# Altium schematic sheet Connector_Venus.SchDoc: Sample Sheet Title
size B; Date: MM/DD/YYYY; Author: Sample Author; Organization: ORGANIZATION; Address1: ADDRESS 1; Address2: ADDRESS 2; Address3: ADDRESS 3; Address4: ADDRESS 4; Revision: -; SheetNumber: 2; SheetTotal: 7; ENG_APP_DATE: --/--/--; DSN_APP_DATE: --/--/--; CHK_APP_DATE: --/--/--
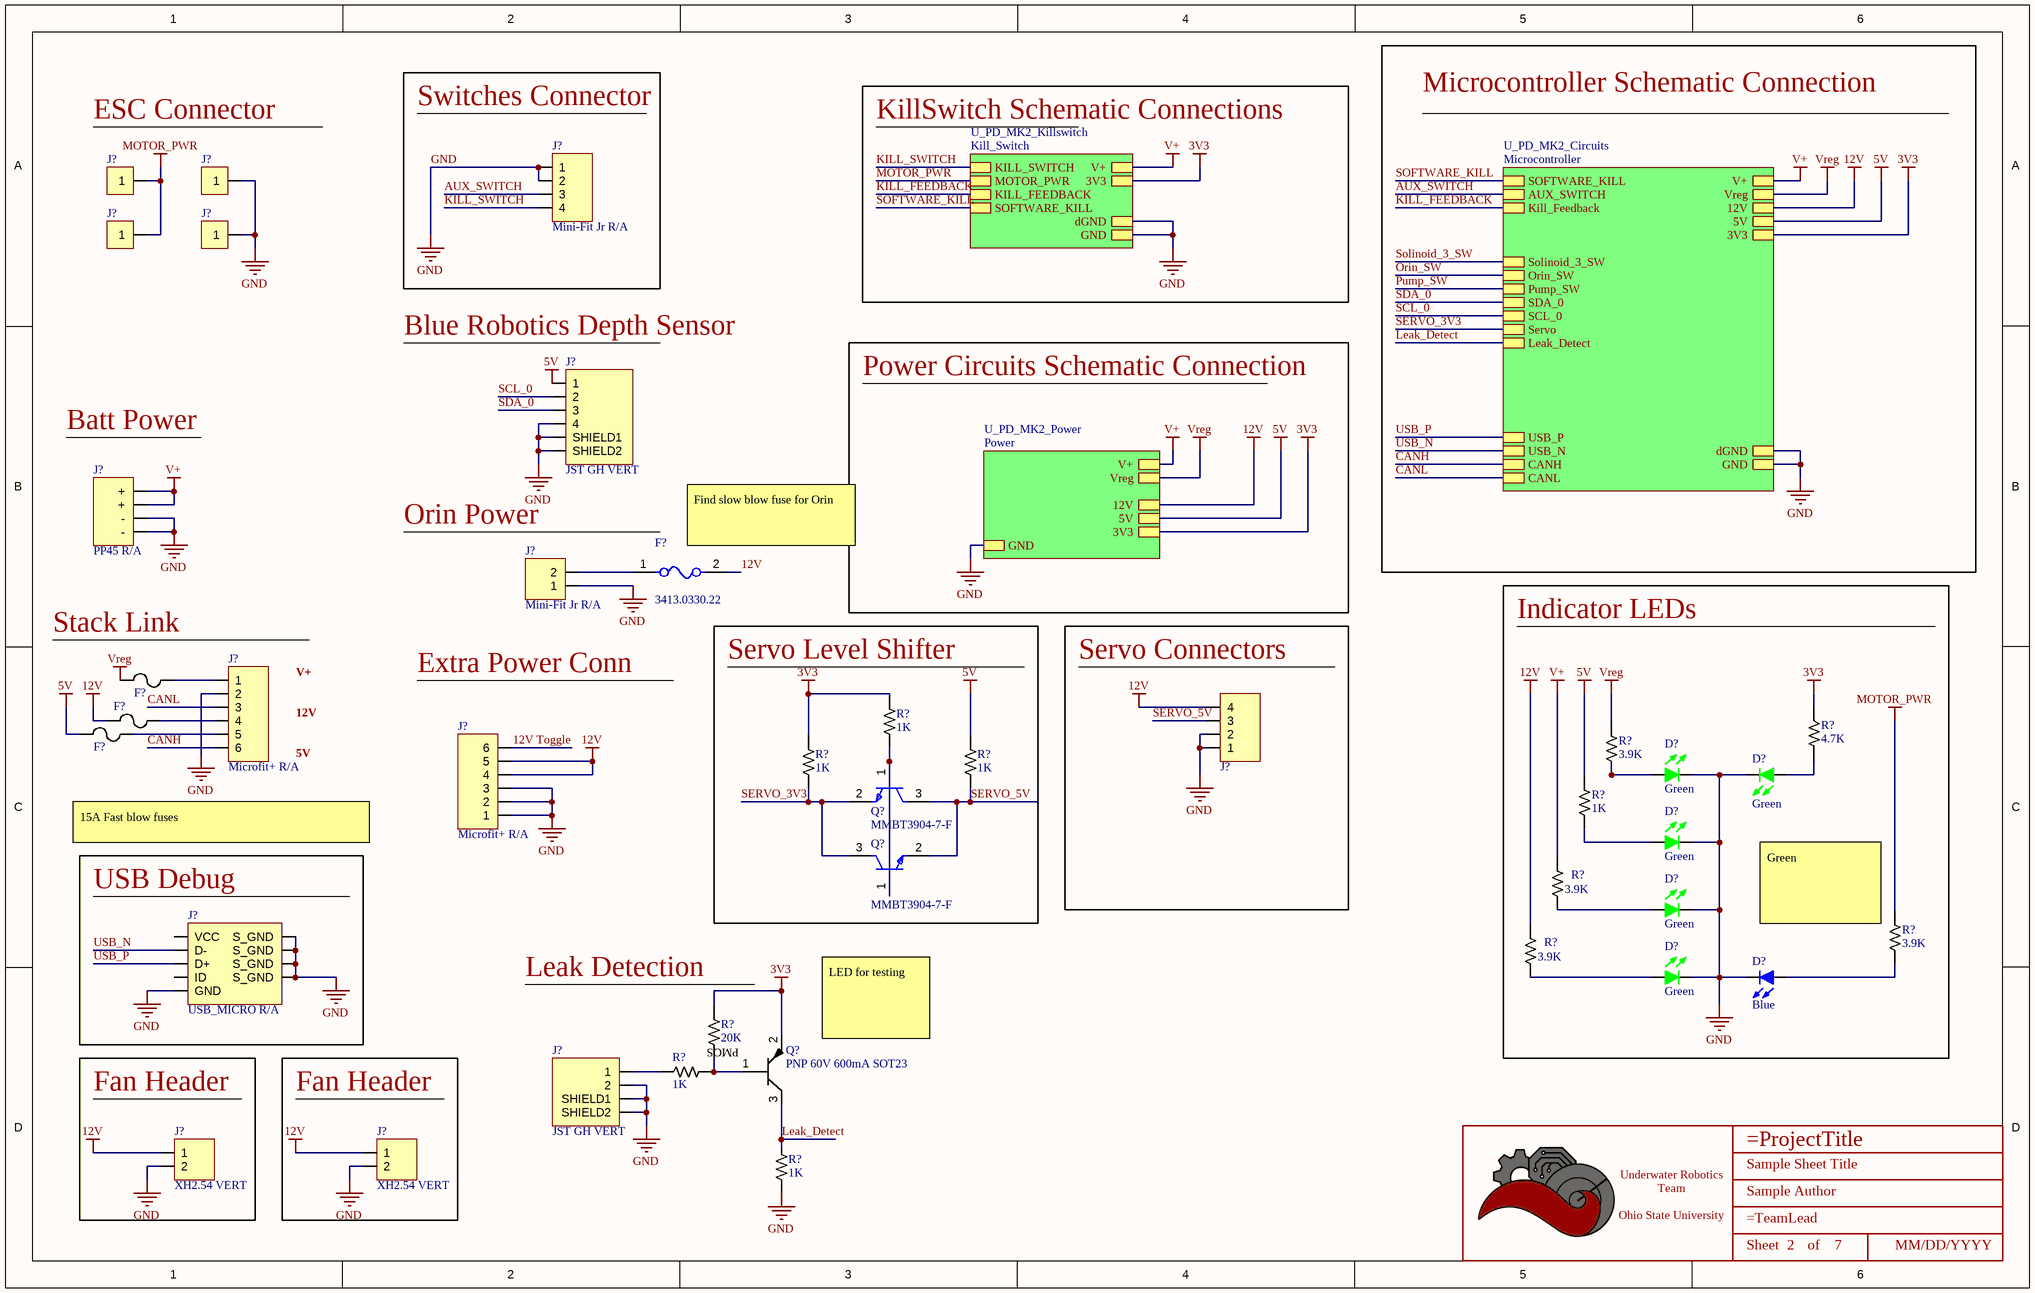
[diagram p0: Connector_Venus.SchDoc]

## Parts
(Parts that share a designator on the sheet are numbered #1, #2 ... from top to bottom, then left to right.)
*  Title_Block  [LOGO]  (value not drawn)  (graphical)
D?#1  Color: Green  [LED_0603]  (hidden comment: IN-S63AT5G)
D?#2  Color: Green  [LED_0603]  (hidden comment: IN-S63AT5G)
D?#3  Color: Green  [LED_0603]  (hidden comment: IN-S63AT5G)
D?#4  Color: Green  [LED_0603]  (hidden comment: IN-S63AT5G)
D?#5  Color: Green  [LED_0603]  (hidden comment: IN-S63AT5G)
D?#6  Color: Blue  [LED_0603]  (hidden comment: 150060BS75000)
F?#1  3413.0330.22  [FP-3413_0330_22-MFG]
F?#2  0685H9150-01  [0501Series_LTF]  (value not drawn)
F?#3  0685H9150-01  [0501Series_LTF]  (value not drawn)
F?#4  0685H9150-01  [0501Series_LTF]  (value not drawn)
J?#1  Mini-Fit Jr R/A  [CONN_MOLEX_MINIFIT JR_4 POS_R/A]
J?#2  Redcube M4 Term 85A  [Redcube M4 Term 85A]  (value not drawn)
J?#3  Redcube M4 Term 85A  [Redcube M4 Term 85A]  (value not drawn)
J?#4  Redcube M4 Term 85A  [Redcube M4 Term 85A]  (value not drawn)
J?#5  Redcube M4 Term 85A  [Redcube M4 Term 85A]  (value not drawn)
J?#6  JST GH VERT  [CONN_JST_BM04B-GHS-TBT(LF)(SN)(N)]
J?#7  PP45 R/A  [CONN_ANDERSON_PP45_4 POS_R/A]
J?#8  Mini-Fit Jr R/A  [CONN_MOLEX_MINIFIT JR_2 POS_R/A]
J?#9  Microfit+ R/A  [CONN_MOLEX_MICROFIT_6_POS_R/A]
J?#10  Microfit+ R/A  [CONN_MOLEX_MICROFIT_4_POS_R/A]  (value not drawn)
J?#11  Microfit+ R/A  [CONN_MOLEX_MICROFIT_6_POS_R/A]
J?#12  USB_MICRO R/A  [CONN_MINIUSB]
J?#13  JST GH VERT  [CONN_JST_SM02B-GHS-TB(LF)(SN)]
J?#14  XH2.54 VERT  [CONN_JST_XH254_2POS_VERT]
J?#15  XH2.54 VERT  [CONN_JST_XH254_2POS_VERT]
Q?#1  MMBT3904-7-F  [FP-SOT23-IPC_A]
Q?#2  MMBT3904-7-F  [FP-SOT23-IPC_A]
Q?#3  PNP 60V 600mA SOT23  [SOT-23-3]
R?#1  Value  (Ohms): 1K  [RESISTOR_0603]  (hidden comment: 1k Ohm 5% 1/8W)
R?#2  Value  (Ohms): 4.7K  [RESISTOR_0603]  (hidden comment: 4.7k Ohm 5% 1/10W)
R?#3  Value  (Ohms): 3.9K  [RESISTOR_0603]  (hidden comment: 3.9k Ohm 5% 1/10W)
R?#4  Value  (Ohms): 1K  [RESISTOR_0603]  (hidden comment: 1k Ohm 5% 1/8W)
R?#5  Value  (Ohms): 1K  [RESISTOR_0603]  (hidden comment: 1k Ohm 5% 1/8W)
R?#6  Value  (Ohms): 1K  [RESISTOR_0603]  (hidden comment: 1k Ohm 5% 1/8W)
R?#7  Value  (Ohms): 3.9K  [RESISTOR_0603]  (hidden comment: 3.9k Ohm 5% 1/10W)
R?#8  Value  (Ohms): 3.9K  [RESISTOR_0603]  (hidden comment: 3.9k Ohm 5% 1/10W)
R?#9  Value  (Ohms): 3.9K  [RESISTOR_0603]  (hidden comment: 3.9k Ohm 5% 1/10W)
R?#10  Value  (Ohms): 20K  [RESISTOR_0402]  (hidden comment: 20k Ohm 1% 1/16W)
R?#11  Value  (Ohms): 1K  [RESISTOR_0603]  (hidden comment: 1k Ohm 5% 1/8W)
R?#12  Value  (Ohms): 1K  [RESISTOR_0603]  (hidden comment: 1k Ohm 5% 1/8W)

## Blocks framed on the sheet
Switches Connector: J?#1
Indicator LEDs: D?#1-D?#6 R?#2 R?#3 R?#6-R?#9
Servo Level Shifter: Q?#1 Q?#2 R?#1 R?#4 R?#5
Servo Connectors: J?#10
USB Debug: J?#12
Fan Header: J?#14
Fan Header: J?#15

## Sub-sheets
U_PD_MK2_Circuits = Microcontroller: GND, V+, 5V, 3V3, SOFTWARE_KILL, AUX_SWITCH, 12V, dGND, Vreg, USB_P, USB_N, CANH, CANL, Kill_Feedback, Solinoid_3_SW, Orin_SW, SDA_0, SCL_0, Pump_SW, Servo, Leak_Detect
U_PD_MK2_Killswitch = Kill_Switch: KILL_SWITCH, MOTOR_PWR, V+, 3V3, dGND, GND, KILL_FEEDBACK, SOFTWARE_KILL
U_PD_MK2_Power = Power: GND, V+, 5V, 3V3, Vreg, 12V

## Nets
3V3: Q?#3.2 R?#1.1 R?#2.2 R?#4.1 R?#10.1 ; sheet U_PD_MK2_Power/3V3, sheet U_PD_MK2_Killswitch/3V3, sheet U_PD_MK2_Circuits/3V3
5V: F?#4.1 J?#6.1 R?#5.1 R?#6.1 ; sheet U_PD_MK2_Power/5V, sheet U_PD_MK2_Circuits/5V
12V: F?#1.2 F?#3.1 J?#10.4 J?#11.4 J?#11.5 J?#14.1 J?#15.1 R?#9.1 ; sheet U_PD_MK2_Power/12V, sheet U_PD_MK2_Circuits/12V
GND: D?#1.2 D?#2.2 D?#3.2 D?#4.2 D?#5.2 D?#6.2 J?#1.1 J?#1.2 J?#3.1 J?#5.1 J?#6.4 J?#6.S1(SHIELD1) J?#6.S2(SHIELD2) J?#7.3(-) J?#7.4(-) J?#8.1 J?#9.2 J?#10.1 J?#10.2 J?#11.1 J?#11.2 J?#11.3 J?#12.5(GND) J?#12.6(S_GND) J?#12.7(S_GND) J?#12.8(S_GND) J?#12.9(S_GND) J?#13.2 J?#13.S1(SHIELD1) J?#13.S2(SHIELD2) J?#14.2 J?#15.2 R?#12.2 ; sheet U_PD_MK2_Power/GND, sheet U_PD_MK2_Killswitch/dGND, sheet U_PD_MK2_Killswitch/GND, sheet U_PD_MK2_Circuits/GND, sheet U_PD_MK2_Circuits/dGND
MOTOR_PWR: J?#2.1 J?#4.1 R?#8.1 ; sheet U_PD_MK2_Killswitch/MOTOR_PWR
V+: J?#7.1(+) J?#7.2(+) R?#7.1 ; sheet U_PD_MK2_Power/V+, sheet U_PD_MK2_Killswitch/V+, sheet U_PD_MK2_Circuits/V+
Vreg: F?#2.1 R?#3.1 ; sheet U_PD_MK2_Power/Vreg, sheet U_PD_MK2_Circuits/Vreg
12V Toggle: J?#11.6
AUX_SWITCH: J?#1.3 ; sheet U_PD_MK2_Circuits/AUX_SWITCH
CANH: J?#9.6 ; sheet U_PD_MK2_Circuits/CANH
CANL: J?#9.3 ; sheet U_PD_MK2_Circuits/CANL
KILL_FEEDBACK: sheet U_PD_MK2_Killswitch/KILL_FEEDBACK, sheet U_PD_MK2_Circuits/Kill_Feedback
KILL_SWITCH: J?#1.4 ; sheet U_PD_MK2_Killswitch/KILL_SWITCH
Leak_Detect: Q?#3.3 R?#12.1 ; sheet U_PD_MK2_Circuits/Leak_Detect
Orin_SW: sheet U_PD_MK2_Circuits/Orin_SW
Pump_SW: sheet U_PD_MK2_Circuits/Pump_SW
SCL_0: J?#6.2 ; sheet U_PD_MK2_Circuits/SCL_0
SDA_0: J?#6.3 ; sheet U_PD_MK2_Circuits/SDA_0
SERVO_3V3: Q?#1.2(E) Q?#2.3(C) R?#4.2 ; sheet U_PD_MK2_Circuits/Servo
SERVO_5V: J?#10.3 Q?#1.3(C) Q?#2.2(E) R?#5.2
SOFTWARE_KILL: sheet U_PD_MK2_Killswitch/SOFTWARE_KILL, sheet U_PD_MK2_Circuits/SOFTWARE_KILL
Solinoid_3_SW: sheet U_PD_MK2_Circuits/Solinoid_3_SW
USB_N: J?#12.2(D-) ; sheet U_PD_MK2_Circuits/USB_N
USB_P: J?#12.3(D+) ; sheet U_PD_MK2_Circuits/USB_P
NetD?#1_1: D?#1.1 R?#3.2
NetD?#2_1: D?#2.1 R?#2.1
NetD?#3_1: D?#3.1 R?#6.2
NetD?#4_1: D?#4.1 R?#7.2
NetD?#5_1: D?#5.1 R?#9.2
NetD?#6_1: D?#6.1 R?#8.2
NetF?#1_1: F?#1.1 J?#8.2
NetF?#2_2: F?#2.2 J?#9.1
NetF?#3_2: F?#3.2 J?#9.4
NetF?#4_2: F?#4.2 J?#9.5
NetJ?#13_1: J?#13.1 R?#11.2
NetQ?#1_1: Q?#1.1(B) Q?#2.1(B) R?#1.2
NetQ?#3_1: Q?#3.1 R?#10.2 R?#11.1

Not connected (* = marked no-connect by the designer): J?#12 1(VCC) 4(ID)

## Notes on the sheet
- Microcontroller Schematic Connection
- ESC Connector
- KillSwitch Schematic Connections
- (near J?#6) Blue Robotics Depth Sensor
- Batt Power
- Power Circuits Schematic Connection
- (near J?#8) Orin Power
- (near F?#1) Find slow blow fuse for Orin
- Stack Link
- V+
- Extra Power Conn
- 12V
- 5V
- 15A Fast blow fuses
- (near R?#8) Green
- (near R?#10) Leak Detection
- (near Q?#3) LED for testing
- DWG. NO.
- REV.
- SHT.
- THIS DOCUMENT AND THE DATA DISCLOSED HEREIN OR HEREWITH IS THE PROPERTY OF ALTIUM LIMITED AND MAY BE FREELY DISTRIBUTED IN WHOLE. NO RIGHTS ARE RESERVED OR EXPRESS OR IMPLIED WARANTEE GIVEN.
- REVISION
- DESCRIPTION
- DATE
- APPROVED
- ENG:
- APPROVALS
- PROJECT
- DSN:
- CHK:
- REFERENCE DOCUMENTS
- PROJECT REVISION:
- TITLE
- DOCUMENT REVISION:
- DESIGN ITEM:
- BOM:
- FAB DWG:
- PCB DWG:
- ASSY DWG:
- SCALE:
- SIZE
- B
- CAGE CODE
- FILE NAME
- DWG NO.
- SHEET
- OF
- REV
- (in symbol MMBT2907A-7-F) PMOS
- (in symbol Title_Block) Underwater Robotics Team / Ohio State University; Sheet; of

## Library data of the parts
* = Title_Block: UWRT Schematic Title Block Template / Created June 2021, Dylan Trainor
D?#1-D?#5 = LED_Green_0603_3V: LED Green Vf= 3V If = 0.005A / IN-S63AT5G; Made By: Robert Pafford; Forward Current: 5mA; ComponentLink1Description: Datasheet; ComponentLink1URL: https://www.we-online.de/katalog/datasheet/150060GS75000.pdf; Forward Voltage: 3V; Package: 0603; Supplier 1: Digi-Key; Supplier Part Number 1: 1830-1062-1-ND
D?#6 = LED_Blue_0603: LED Blue Vf= 3.2V If = 0.020A / 150060BS75000; Made By: Robert Pafford; Forward Current: 20mA; Forward Voltage: 3.2V; Package: 0603; Supplier 1: Digi-Key; Supplier Part Number 1: 732-4966-1-ND
F?#1 = CMP-26293-000001-1: FUSE BOARD MNT 15A 32VAC 63VDC; Manufacturer: Schurter Inc; Max Fuse Ac Voltage: 32V; Fuse Voltage Drop: 57mV; Value: 3.5mΩ; Voltage Rating: 63V; Fuse Blow Speed: Slow; Fuse Interrupt Dc Current: 100A; Fuse I2T: 65A2Sec; Automotive: No; Ambient Temperature Range High: +90°C; RoHS: TRUE; Digikey Description: FUSE BOARD MNT 15A 32VAC 63VDC; Height: 0.6mm; Manufacturer Part Number: 3413.0330.22; Mouser Description: Surface Mount Fuses UST 1206 FUSE 15A F; Device Class L1: Circuit Protection; Ipc Land Pattern Name: CAPC320160X60; ComponentLink2URL: https://us.schurter.com/en/datasheet/typ_UST_1206.pdf; Resistance: 3.5mΩ; ComponentLink2Description: Datasheet; Octopart: https://octopart.com/3413.0330.22-schurter-8400836; Max Fuse Dc Voltage: 63V; Fuse Current: 15A; Category: Fuse; Device Class L3: unset; Package: 0; Ambient Temperature Range Low: -55°C; Device Class L2: Fuses; Lead Free: Yes
F?#2-F?#4 = Bel Fuse 15A: Bel Fuse  | 15A | 32V DC | SMD | Fast Blow | 1206; Current Rating: 15; Breaking Capacity: 150A; Mfr_Name: Bel Fuse; Manufacturer_Part_Number: 0685H9150-01; Voltage Rating: 32V; Response Time: Fast Blow; Package: 1206; Created By: Nathan Ayer
J?#1 = CONN_MOLEX_MINIFIT JR_4POS_R/A: Molex Minifit Jr. 5569 / 4 Pos R/A Natural; Pitch: 4.2mm; Configuration: Right Angle; Current Per Pin: 13A; Number of Positions: 4; Supplier Part Number 1: WM13112-ND; Supplier 1: Digi-Key; Manufacturer: Molex; Color: Natural; Created By: Flip B; ComponentLink1Description: Datasheet; ComponentLink1URL: https://www.molex.com/pdm_docs/sd/026013115_sd.pdf; Series: Minifit Jr 5569
J?#6 = CONN_JST_GH_4POS_VERT: JST GH Pitch 4 Pos Vertical; Pitch: 1.25mm; Current Per Pin: 1A; Number of Positions: 4; Manufacturer: JST; Configuration: Vertical; Color: Natural; Created By: Robert P; Series: GH; Supplier 1: Digi-Key; Supplier Part Number 1: 455-1580-1-ND
J?#7 = CONN_ANDERSON_2x2_R/A: Anderson PP45 / 4 Pos R/A Red/Black; Pitch: 7.9mm; Configuration: Right Angle; Current Per Pin: 45A; Number of Positions: 4; Manufacturer: Anderson; Color: Red/Black; Created By: Flip B; ComponentLink1Description: Datasheet; ComponentLink1URL: https://www.andersonpower.com/content/dam/app/ecommerce/product-pdfs/DS-PP1545.pdf; Series: PowerPole 45; Supplier 1: Digi-Key; Supplier Part Number 1: 2243-1337G1-ND; Supplier 2: Digi-Key; Supplier Part Number 2: 2243-1336G1-ND; Supplier 3: Digi-Key; Supplier Part Number 3: 2243-1327-BK-ND; Supplier 4: Digi-Key; Supplier Part Number 4: A102007-ND
J?#8 = CONN_MOLEX_MINIFIT JR_2POS_R/A: Molex Minifit Jr. 5569 / 2 Pos R/A Natural; Pitch: 4.2mm; Configuration: Right Angle; Current Per Pin: 13A; Number of Positions: 2; Manufacturer: Molex; Color: Natural; Created By: Robert P; ComponentLink1Description: Datasheet; ComponentLink1URL: https://www.molex.com/pdm_docs/sd/026013115_sd.pdf; Series: Minifit Jr 5569; Supplier 1: Digi-Key; Supplier Part Number 1: WM1351-ND
J?#9 J?#11 = CONN_MOLEX_MICROFIT+_6POS_R/A: Molex Microfit+ / 212528 6 POS R/A Black; Pitch: 3.0mm; Current Per Pin: 12.5; Supplier 1: Digikey; Supplier Part Number 1: 900-2125280600-ND; Manufacturer: Molex; Configuration: R/A; Color: Black
J?#10 = CONN_MOLEX_MICROFIT+_4POS_R/A: Molex Microfit+ / 212528 4 POS R/A Black; Pitch: 3.0mm; Current Per Pin: 12.5A; Manufacturer: Molex; Supplier 1: Digikey; Supplier Part Number 1: 900-2125280400-ND; Configuration: R/A; Color: Black
J?#12 = CONN_MICROUSB: Amphenol Micro USB-B / USB2.0 5 Pin Right Angle SMD; Pitch: 0.65mm; Current Per Pin: 1.8A; Number of Positions: 5; Manufacturer: Amphenol; Configuration: Right Angle; Color: Silver; Created By: Flip B; ComponentLink1Description: Datasheet; ComponentLink1URL: https://cdn.amphenol-icc.com/media/wysiwyg/files/documentation/datasheet/inputoutput/io_usb_micro.pdf?__cf_chl_jschl_tk__=05693735e19256298f6ef6ca2bb2e65c376a4f56-1625503833-0-Abitsb0-ufjOXJYs_S3J3r2iTn-nObalbmXUksF1VvO_h_WEmRdMlUD1I8-hmWSEVWzY1pirKnrPZWfgY3851qyBZe5ZvnNQePLGIzUgdEIQBVUyW36RsbYpDLEWxJ4horD-5gChFgobLYqwmG5aHl0E8lIn_twwPPrOxilK2gP0q9t_CNOs_u5fMqXvXUrlsOv8tIE2NRlu6NVP8qtkL2GjhlkeTUbDMF8WvvpPDTFOgvZ4Y16Ej8F8AhWos88mo5B1HssXozw0XrkJQIqERITUu6rqloz9kf4ZzhBHtDAt-IkiAFY_Ds9SW8FYKKTtINJVpHZQ6Gyu1FFM4Dc9MO0maE8_mmNcwlxqyRoRk_MPWW8VyByXWM5RSp52jteRKw7FeI9WIYvCbPAOy0Eyib-aseIQsnGbglBcUY6_2xp8GYaJM38H3dNvBPsSOfJBPndKedwKHllxjkucXn6xsN0sDXkpGN-cu8_2bDTJ0g-uUucKSCooYX-ApSDNGpkA_p9zv1SOAD8c0zaZVmtiBsN75QpVz2rzq9_BFxOywPvR; Series: 10118192; Supplier 1: Digi-Key; Supplier Part Number 1: 609-4613-1-ND
J?#13 = CONN_JST_GH_2POS_VERT: JST GH Pitch 2 Pos Vertical; Pitch: 1.25mm; Current Per Pin: 1A; Number of Positions: 4; Manufacturer: JST; Configuration: Vertical; Color: Natural; Created By: Robert P; Series: GH; Supplier 1: Digi-Key; Supplier Part Number 1: 455-1564-1-ND
J?#14 J?#15 = CONN_JST_XH254_2POS_VERT: JST XH 2.54mm Pitch 2 Pos Vertical; Current Per Pin: 4A; Number of Positions: 2; NOTE: Do not use JST 2.5mm parts with this footprint. JST does not make 2.54mm pitch pins, rather only clones make this connector!; Manufacturer: JST; Pitch: 2.54mm; Configuration: Vertical; Color: White; Created By: Robert P; Series: XH 2.54; ComponentLink1Description: Purchase Link; ComponentLink1URL: https://www.amazon.com/460PCS-XH2-54-Connector-Terminal-Connectors/dp/B09DBGVX5C
Q?#1 Q?#2 = CMP-2000-04931-2: TRANS NPN 40V 0.2A SMD SOT23-3; Frequency: 300MHz; Power Dissipation: 350mW; Element Configuration: Single; Max Power Dissipation: 300mW; Max Collector Current: 200mA; Collector Emitter Saturation Voltage: 300mV; Number of Elements: 1; hFE Min: 100; Collector Base Voltage (VCBO): 60V; Emitter Base Voltage (VEBO): 6V; Contact Plating: Tin; Package Quantity: 3000; Max Frequency: 300MHz; REACH SVHC: No SVHC; Max Operating Temperature: 150°C; Width: 1.4mm; Collector Emitter Voltage (VCEO): 40V; Voltage Rating (DC): 40V; Radiation Hardening: No; Case/Package: SOT-23; Height: 1mm; Collector Emitter Breakdown Voltage: 40V; Length: 3.05mm; Polarity: NPN; Packaging: Tape and Reel; Number of Pins: 3; Min Operating Temperature: -55°C; Gain Bandwidth Product: 300MHz; Mount: Surface Mount; Weight: 0.000282oz; Continuous Collector Current: 200mA; Transition Frequency: 300MHz; Max Breakdown Voltage: 40V; Lead Free: Lead Free
Q?#3 = MMBT2907A-7-F: PNP 60 V 600mA Surface Mount SOT-23; Vendor: Digikey; Vgs (Max): ±10V; Vgs (th): 800mV @ 250µA; Vdss: 20 V; Power Dissipation: 1.56W (Tc); Rds (on): 50mOhm @ 3A, 4.5V; Amp Rating: 600mA; BJT Type: PNP; Package: TO-236-3, SC-59, SOT-23-3; Manufacturer_Part_Number: MMBT2907A-7-F; Created By: Robert Pafford; ComponentLink1Description: Datasheet; ComponentLink1URL: https://media.digikey.com/pdf/Data%20Sheets/Diodes%20PDFs/MMBT2907A_Rev2016.pdf; Supplier 1: Digi-Key; Supplier Part Number 1: MMBT2907A-FDICT-ND
R?#1 R?#4-R?#6 R?#11 R?#12 = RESISTOR_1K_0603: RES 1k OHM 5% 1/8W 0603; Tolerance: +/- 5%; Made By: Robert Pafford; ComponentLink1Description: Datasheet; ComponentLink1URL: https://www.bourns.com/docs/product-datasheets/CRxxxxx.pdf; Wattage: 1/8W; Supplier: Digikey; Digikey Part Numer: CR0603-JW-104ELFTR-ND; Supplier 1: Digi-Key; Supplier Part Number 1: 2019-RK73B1JTTD102JCT-ND
R?#2 = RESISTOR_4.7K_0603: RES 4.7k OHM 5% 1/10W 0603; Tolerance: +/- 5%; Made By: Robert Pafford; Wattage: 1/10W; Supplier: Digikey; Digikey Part Numer: CR0603-JW-104ELFTR-ND; Supplier 1: Digi-Key; Supplier Part Number 1: RMCF0603JT4K70CT-ND
R?#3 R?#7-R?#9 = RESISTOR_3.9K_0603: RES 3.9k OHM 1% 1/10W 0603; Tolerance: +/- 1%; Made By: Robert Pafford; Wattage: 1/10W; Supplier 1: Digi-Key; Supplier Part Number 1: P3.90KHCT-ND
R?#10 = RESISTOR_20K_0402: RES 20k OHM 1% 1/16W 0402; Tolerance: +/- 1%; Made By: Robert Pafford; Wattage: 1/16W; Supplier 1: Digikey; Supplier Part Number 1: YAG3454CT-ND
J?#2-J?#5 = Redcube M4 Term 85A: Created By: Nahtan Ayer; Current Rating: 85 A; Screw Size: M4